# EAGLE schematic Planet_Mechenics_project (EAGLE 9.6.2)
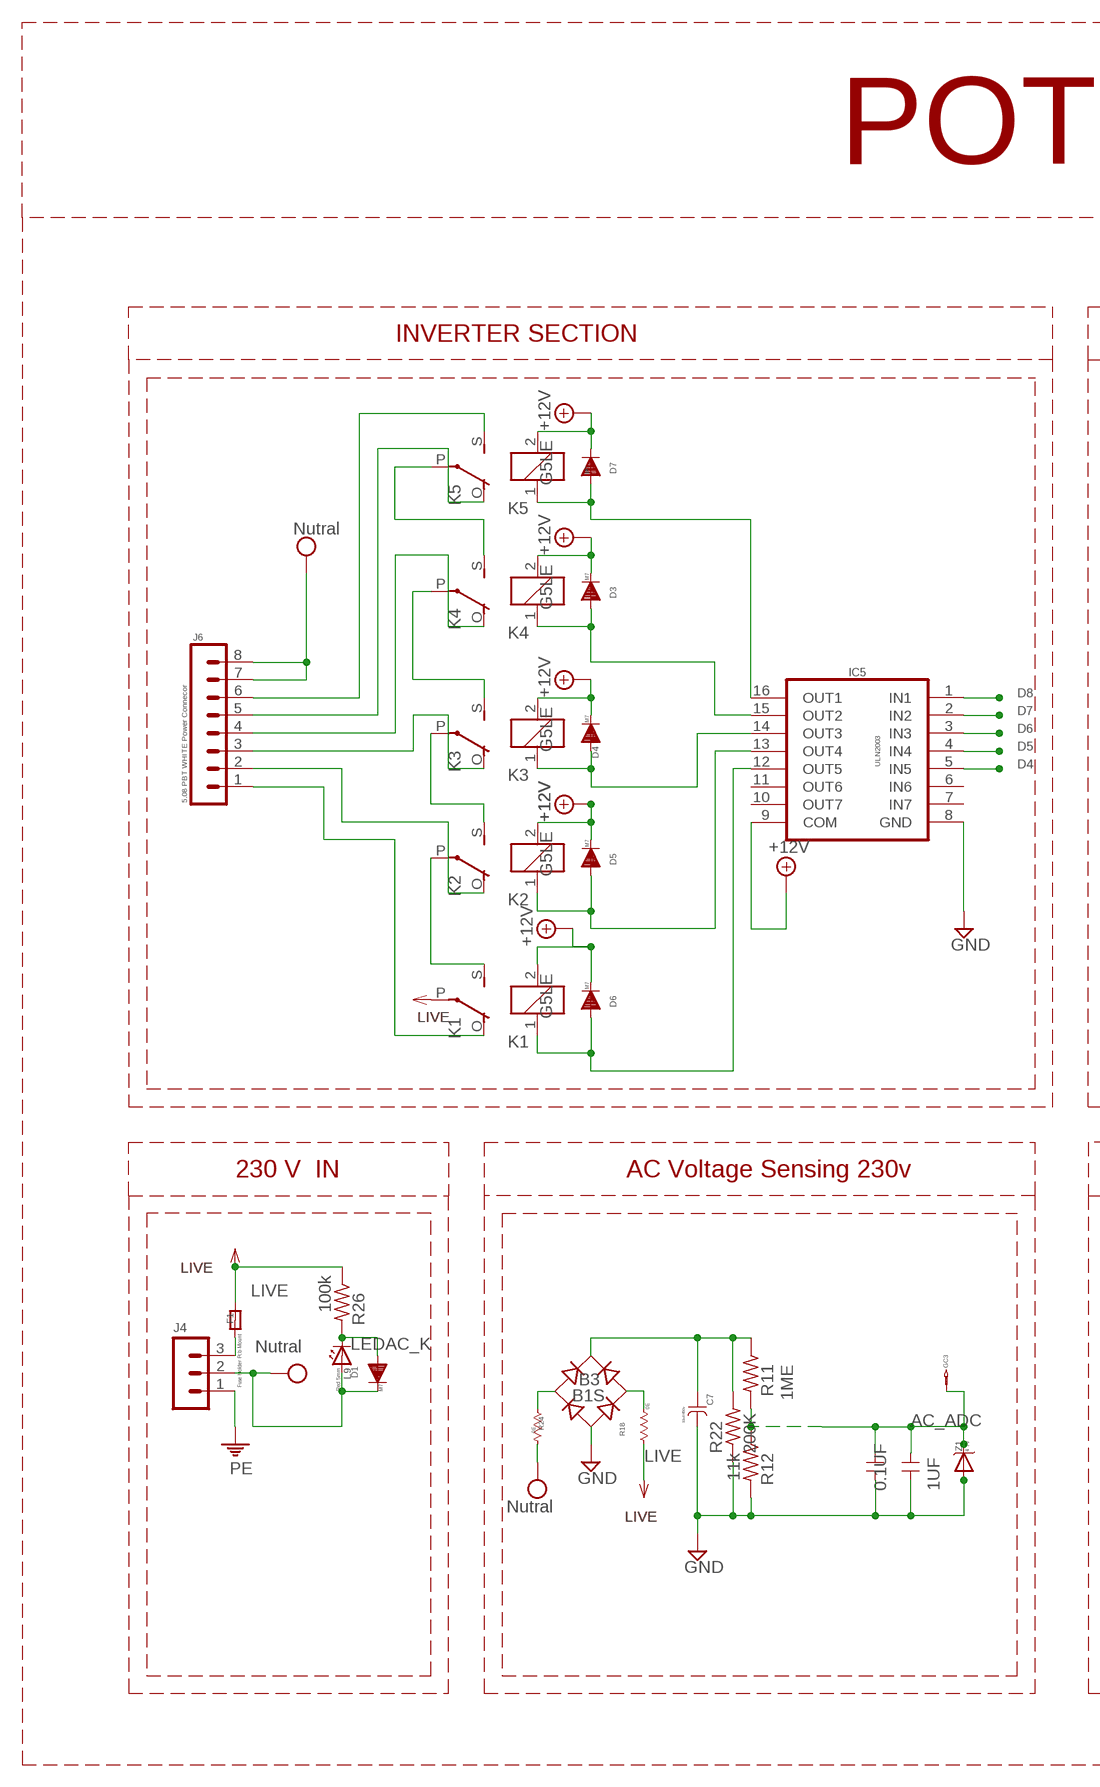
[diagram p0: schematic, sheet 1, part 1 of 2]
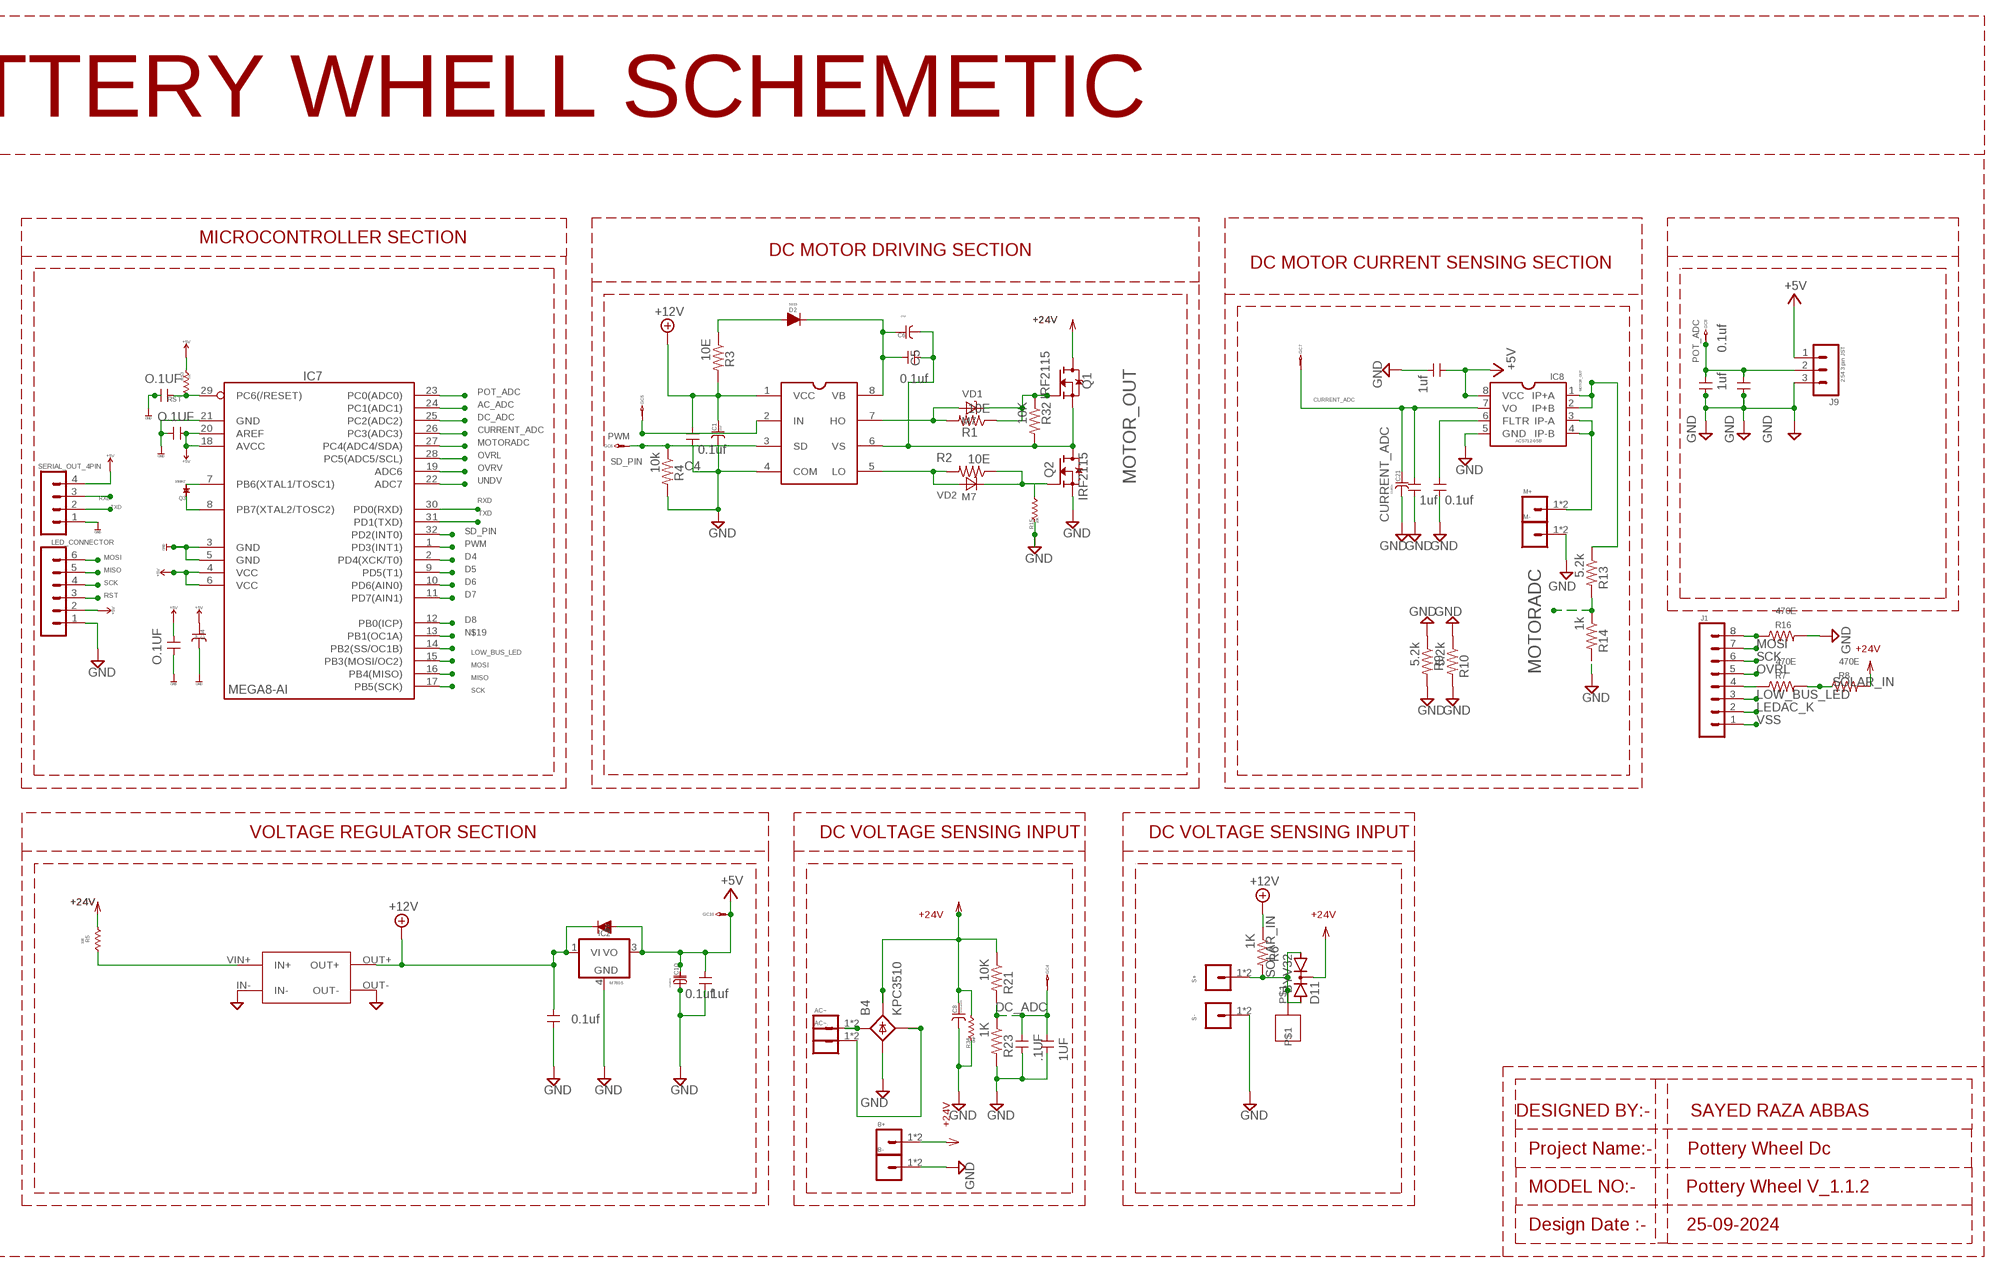
[diagram p1: schematic, sheet 1, part 2 of 2]

## Parts
AC~  JST_1-PINBARR  [1-PIN_9.6]
AC~.  JST_1-PINBARR  [1-PIN_9.6]
B3  B1S  [MBS]
B4  KPC3510  B25A-  [B25A-]
B+  JST_1-PINBARR  [1-PIN_9.6]
B-  JST_1-PINBARR  [1-PIN_9.6]
C1  10uf  CAP_ELE6_V  [C_6_V]
C4  0.1uf  C-USC1206  [C1206]
C5  0.1uf  C-USC1206  [C1206]
C6  10uf  CAP_ELE6_V  [C_6_V]
C7  10uf/450v  CAP_ELE8_V  [C_8_V]
C8  4700uf/50V  CAP_ELE19MM  [C_19MM]
C9  1uf  C-USC1206  [C1206]
C10  10uf/63v  CAP_ELE8_V  [C_8_V]
C13  0.1uf  C-USC1206  [C1206]
C15  0.1uf  C-USC1206  [C1206]
C16  1uf  C-USC1206  [C1206]
C17  0.1uf  C-USC1206  [C1206]
C18  1uf  C-USC1206  [C1206]
C20  1uf  C-USC1206  [C1206]
C21  10uf/63v  CAP_ELE5_V  [C_5_V]
C22  .1UF  C-USC1206  [C1206]
C23  1UF  C-USC1206  [C1206]
C24  0.1UF  C-USC1206  [C1206]
C25  1UF  C-USC1206  [C1206]
C28  O.1UF  C-USC1206  [C1206]
C29  O.1UF  C-USC1206  [C1206]
C30  O.1UF  C-USC1206  [C1206]
C34  DNP  CAP_TANTA  [TANT_1206]
C36  0.1uf  C-USC1206  [C1206]
D1  M7  DIODE  [SMB]
D2  5819  DIODE80  [SOD-80]
D3  M7  DIODE  [SMB]
D4  M7  DIODE  [SMB]
D5  M7  DIODE  [SMB]
D6  M7  DIODE  [SMB]
D7  M7  DIODE  [SMB]
D9  M7  DIODE  [SMB]
D11  BYV32  [TO220ABS]
F1  Fuse Holder Pcb Mount  FUSEBOX  [FH_BOX]
GC3  PTR1PAD1-17Y  [P1-17Y]
GC4  PTR1PAD1-17Y  [P1-17Y]
GC5  PTR1PAD1-17Y  [P1-17Y]
GC6  PTR1PAD1-17Y  [P1-17Y]
GC7  PTR1PAD1-17Y  [P1-17Y]
GC8  PTR1PAD1-17Y  [P1-17Y]
GC10  PTR1PAD1-17Y  [P1-17Y]
IC2  M7805  78XXDPAK  [DPAK]
IC5  ULN2003  ULN2003SO  [SOIC-16]
IC7  MEGA8-AI  [TQFP32-08]
IC8  ACS712-05B  ACS712-20TSOIC  [SO-08]
J1  JST_8-PINM  [MOLEX_8-PIN]
J4  JST_3-PIN7.62  [3-PIN_7.62]
J6  5.08 PBT WHITE Power Connecor  JST_8-PIN5.08  [8-PIN_5.08_PWR]
J9  2.54 3 pin JST  JST_3-PINM  [MOLEX_3-PIN]
K1  G5LE  [G5LE]
K2  G5LE  [G5LE]
K3  G5LE  [G5LE]
K4  G5LE  [G5LE]
K5  G5LE  [G5LE]
L9  Red 5mm  LED5MM  [LED_5MM]
LED_CONNECTOR  JST_6-PINM  [MOLEX_6-PIN]
M+  JST_1-PINBARR  [1-PIN_9.6]
M-  JST_1-PINBARR  [1-PIN_9.6]
Q1  IRF2115  IRF5210  [TO254P1054X469X2933-3]
Q2  IRF2115  IRF5210  [TO254P1054X469X2933-3]
Q3  16MHZ  CRYSTALHC49S  [HC49/S]
R1  10E  R-US_M1206  [M1206]
R2  10E  R-US_M1206  [M1206]
R3  10E  R-US_M1206  [M1206]
R4  10k  R-US_M1206  [M1206]
R5  10E  RESISTOR2L  [RES_2W_L]
R6  1K  R-US_M1206  [M1206]
R7  470E  R-US_M1206  [M1206]
R8  470E  R-US_M1206  [M1206]
R9  5.2k  R-US_M1206  [M1206]
R10  5.2k  R-US_M1206  [M1206]
R11  1ME  R-US_M1206  [M1206]
R12  11k  R-US_M1206  [M1206]
R13  5.2k  R-US_M1206  [M1206]
R14  1k  R-US_M1206  [M1206]
R15  10K  RESISTORM1  [1206]
R16  470E  R-US_M1206  [M1206]
R18  0E  RESISTOR2V  [2W]
R21  10K  R-US_M1206  [M1206]
R22  200K  R-US_R2512  [R2512]
R23  1K  R-US_M1206  [M1206]
R24  0E  RESISTOR2V  [2W]
R26  100k  R-US_M1206  [M1206]
R32  10K  R-US_M1206  [M1206]
R34  DNP  RESISTORM1  [1206]
R53  10K  RESISTORM  [0805]
S+  JST_1-PINBARR  [1-PIN_9.6]
S-  JST_1-PINBARR  [1-PIN_9.6]
SERIAL_OUT_4PIN  JST_4-PINM  [MOLEX_4-PIN]
U$1  IR2104S  [IR2104S]
U$2  PADOPENING  [PADOPENING]
U$3  XL7015  [XL7015]
VD1  M7  DIODE-TVS-UNIDIR-SMB  [SMB]
VD2  M7  DIODE-TVS-UNIDIR-SMB  [SMB]
Z1  4.7V  Z_DIODE  [SMB_Z]

## Nets
+5V: C10.+ C16.1 C17.1 C18.1 C28.2 C30.2 C34.+ D9.A GC10.TP IC2.3(VO) IC7.4(VCC) IC7.6(VCC) IC7.18(AVCC) IC7.20(AREF) IC8.8(VCC) J9.1 LED_CONNECTOR.2 R53.2 SERIAL_OUT_4PIN.4
+12V: C1.+ C4.1 C13.1 D3.K D4.K D5.K D6.K D7.K D9.K IC2.1(VI) IC5.9(COM) K1.2 K2.2 K3.2 K4.2 K5.2 R3.2 R6.1 U$1.1(VCC) U$3.OUT+
+24V: B4.+ B4.+1(+) B+.1 B+.2 C8.1(+) D11.C Q1.DRAIN R5.1 R8.2 R21.1 R34.2
AC_ADC: C24.1 C25.1 GC3.TP IC7.24(PC1(ADC1)) R11.2 R12.1 Z1.K
CURRENT_ADC: C20.1 C21.+ GC7.TP IC7.26(PC3(ADC3)) IC8.7(VO)
D4: IC5.5(IN5) IC7.2(PD4(XCK/T0))
D5: IC5.4(IN4) IC7.9(PD5(T1))
D6: IC5.3(IN3) IC7.10(PD6(AIN0))
D7: IC5.2(IN2) IC7.11(PD7(AIN1))
D8: IC5.1(IN1) IC7.12(PB0(ICP))
DC_ADC: C22.1 C23.1 GC4.TP IC7.25(PC2(ADC2)) R21.2 R23.1
GND: B3.- B4.- B4.-1(-) B-.1 B-.2 C1.- C4.2 C7.- C8.2(-) C9.2 C10.- C13.2 C15.2 C16.2 C17.2 C18.2 C20.2 C21.- C22.2 C23.2 C24.2 C25.2 C28.1 C29.1 C30.1 C34.- C36.2 IC2.4(GND) IC5.8(GND) IC7.3(GND) IC7.5(GND) IC7.21(GND) IC8.5(GND) J9.3 LED_CONNECTOR.1 M-.1 M-.2 Q2.SOURCE R4.2 R9.1 R9.2 R10.1 R10.2 R12.2 R14.2 R15.1 R16.2 R22.1 R23.2 R34.1 S-.1 S-.2 SERIAL_OUT_4PIN.1 U$1.4(COM) U$3.IN- U$3.OUT- Z1.A
LEDAC_K: D1.A J1.2 L9.K R26.2
LIVE: F1.2 K1.P(2:P) R18.1 R26.1
LOW_BUS_LED: IC7.14(PB2(SS/OC1B)) J1.3
MISO: IC7.16(PB4(MISO)) LED_CONNECTOR.5
MOSI: IC7.15(PB3(MOSI/OC2)) J1.7 LED_CONNECTOR.6
MOTOR_OUT: C5.2 C6.- IC8.1(IP+A) IC8.2(IP+B) Q1.SOURCE Q2.DRAIN R13.1 R32.2 U$1.6(VS)
MOTORADC: IC7.27(PC4(ADC4/SDA)) R13.2 R14.1
N$1: R1.2 U$1.7(HO) VD1.A
N$2: R2.2 U$1.5(LO) VD2.A
N$3: Q2.GAET(GATE) R2.1 R15.2 VD2.C
N$4: R5.2 U$3.VIN+(IN+)
N$5: AC~.1 AC~.2 B4.AC1 B4.AC1-(AC1)
N$6: Q1.GAET(GATE) R1.1 R32.1 VD1.C
N$7: F1.1 J4.3
N$8: C5.1 C6.+ D2.K U$1.8(VB)
N$9: D2.A R3.1
N$10: C15.1 IC8.6(FLTR)
N$11: AC~..1 AC~..2 B4.AC2 B4.AC2-(AC2)
N$12: J6.1 K1.O(2:O)
N$13: K1.S(2:S) K2.P(2:P)
N$14: J6.2 K2.O(2:O)
N$15: K2.S(2:S) K3.P(2:P)
N$16: K3.S(2:S) K4.P(2:P)
N$17: J6.3 K3.O(2:O)
N$18: J6.4 K4.O(2:O)
N$19: IC7.13(PB1(OC1A))
N$20: D4.A IC5.14(OUT3) K3.1
N$22: D6.A IC5.12(OUT5) K1.1
N$23: J1.4 R7.1
N$25: D5.A IC5.13(OUT4) K2.1
N$28: IC7.7(PB6(XTAL1/TOSC1)) Q3.2
N$29: K4.S(2:S) K5.P(2:P)
N$30: J6.5 K5.O(2:O)
N$31: J6.6 K5.S(2:S)
N$32: B3.AC1 R24.1
N$34: D3.A IC5.15(OUT2) K4.1
N$36: IC7.8(PB7(XTAL2/TOSC2)) Q3.1
N$37: D7.A IC5.16(OUT1) K5.1
N$38: B3.AC2 R18.2
N$40: B3.+ C7.+ R11.1 R22.2
N$47: IC8.3(IP-A) IC8.4(IP-B) M+.1 M+.2
N$50: J1.8 R16.1
OVRL: IC7.28(PC5(ADC5/SCL)) J1.5
OVRV: IC7.19(ADC6)
PE: J4.1
POT_ADC: C9.1 C36.1 GC8.TP IC7.23(PC0(ADC0)) J9.2
PWM: GC5.TP IC7.1(PD3(INT1)) U$1.2(IN)
RST: C29.2 IC7.29(PC6(/RESET)) LED_CONNECTOR.3 R53.1
RXD: IC7.30(PD0(RXD)) SERIAL_OUT_4PIN.3
SCK: IC7.17(PB5(SCK)) J1.6 LED_CONNECTOR.4
SD_PIN: GC6.TP IC7.32(PD2(INT0)) R4.1 U$1.3(SD)
SOLAR_IN: D11.A1 D11.A2 R6.2 R7.2 R8.1 S+.1 S+.2 U$2.P$1
TXD: IC7.31(PD1(TXD)) SERIAL_OUT_4PIN.2
UNDV: IC7.22(ADC7)
VSS: D1.K J1.1 J4.2 J6.7 J6.8 L9.A R24.2 ; supply symbol labelled Nutral
Unconnected: IC5.6(IN6) IC5.7(IN7) IC5.10(OUT7) IC5.11(OUT6)

## Notes on the sheet
- POTTERY WHELL SCHEMETIC
- INVERTER SECTION | MICROCONTROLLER SECTION
- DC MOTOR DRIVING SECTION
- DC MOTOR CURRENT SENSING SECTION
- 230 V  IN | AC Voltage Sensing 230v | VOLTAGE REGULATOR SECTION | DC VOLTAGE SENSING INPUT | DC VOLTAGE SENSING INPUT
- DESIGNED BY:-        SAYED RAZA ABBAS
- Project Name:-       Pottery Wheel Dc
- MODEL NO:-          Pottery Wheel V_1.1.2
- Design Date :-        25-09-2024

## Library data of the parts
AC~ AC~. B+ B- M+ M- S+ S- = Squadron:JST_1-PIN
B3 = rectifier:B*S: Surface Mount Glass Passivated Bridge Rectifiers Source: Comchip Bridge Rectifiers B05S-G_B10S-G.pdf
B4 = rectifier:B25A-: RECTIFIER 25-A bridge
C1 C6-C8 C10 C21 = Squadron:CAP_ELE
C4 C5 C9 C13 C15-C18 C20 C22-C25 C28-C30 C36 = rcl:C-US: CAPACITOR, American symbol; SPICEPREFIX: C
C34 = Squadron:CAP_TANT
D1-D7 D9 = Squadron:DIODE
D11 = diode:BYV32: DIODE 2 x Si diode 200 V, 20 A/230 Apeak, 25 ns
F1 = Squadron:FUSE
GC3-GC8 GC10 = testpad:PTR1: TEST PIN
IC2 = Squadron:78XX
IC5 = Squadron:ULN2003
IC7 = atmel:MEGA8: MICROCONTROLLER 8 Kbytes FLASH, 1 kbytes SRAM, 512 bytes EEPROM, USART, 6-channel 10 bit ADC, 2-channel 8 bit ADC Pin compatible with Atmega48, ATMega88, ATMega168 Source: avr.lbr; MPN: ATMEGA8-16AU; OC_FARNELL: 9171371; OC_NEWARK: 73M8863
IC8 = R_Sol:ACS712-20T
J1 J6 = Squadron:JST_8-PIN
J4 J9 = Squadron:JST_3-PIN
K1-K5 = relay:G5LE: RELAY 1 x switch, 10 A/120 V AC, 8 A/30 V DC, Omron
L9 = Squadron:LED
LED_CONNECTOR = Squadron:JST_6-PIN
Q1 Q2 = IRFB4110:IRF5210: Check availability <https://pricing.snapeda.com/parts/IRF5210/Infineon%20Technologies/view-part?ref=eda>; AVAILABILITY: In Stock; CHECK_PRICES: https://www.snapeda.com/parts/IRF5210/Infineon+Technologies/view-part/?ref=eda; DESCRIPTION: P-Channel 100 V 38A (Tc) 3.1W (Ta), 170W (Tc) Through Hole TO-262; MF: Infineon Technologies; MP: IRF5210; PACKAGE: TO-220 Infineon; PRICE: None; SNAPEDA_LINK: https://www.snapeda.com/parts/IRF5210/Infineon+Technologies/view-part/?ref=snap
Q3 = crystal:CRYSTAL: CRYSTAL; OC_FARNELL: 1667008; OC_NEWARK: unknown
R1-R4 R6-R14 R16 R21-R23 R26 R32 = rcl:R-US_: RESISTOR, American symbol; SPICEPREFIX: R
R5 R15 R18 R24 R34 R53 = Squadron:RESISTOR
SERIAL_OUT_4PIN = Squadron:JST_4-PIN
U$1 = IR2104S:IR2104S: Half Bridge Mosfet - IGBT driver SOIC Check availability <https://pricing.snapeda.com/parts/IR2104S/Infineon%20Technologies/view-part?ref=eda>; AVAILABILITY: In Stock; CHECK_PRICES: https://www.snapeda.com/parts/IR2104S/Infineon+Technologies/view-part/?ref=eda; DESCRIPTION: Half-Bridge Gate Driver IC Non-Inverting 8-SOIC; MF: Infineon Technologies; MP: IR2104S; PACKAGE: SO-8 Infineon; PRICE: None; PURCHASE-URL: https://www.snapeda.com/api/url_track_click_mouser/?unipart_id=582439&manufacturer=Infineon Technologies&part_name=IR2104S&search_term=None; SNAPEDA_LINK: https://www.snapeda.com/parts/IR2104S/Infineon+Technologies/view-part/?ref=snap
U$2 = Squadron:PADOPENING
U$3 = Squadron:XL7015
VD1 VD2 = diode:DIODE-TVS-UNIDIR-
Z1 = Squadron:Z_DIODE